# Altium schematic sheet Brojilo_zaslon.SchDoc
size A3; SheetNumber: 1; SheetTotal: 1; SPICEModelCacheWJDCJOHJ: <root> / <DocumentId>WJDCJOHJ</DocumentId> / </root>
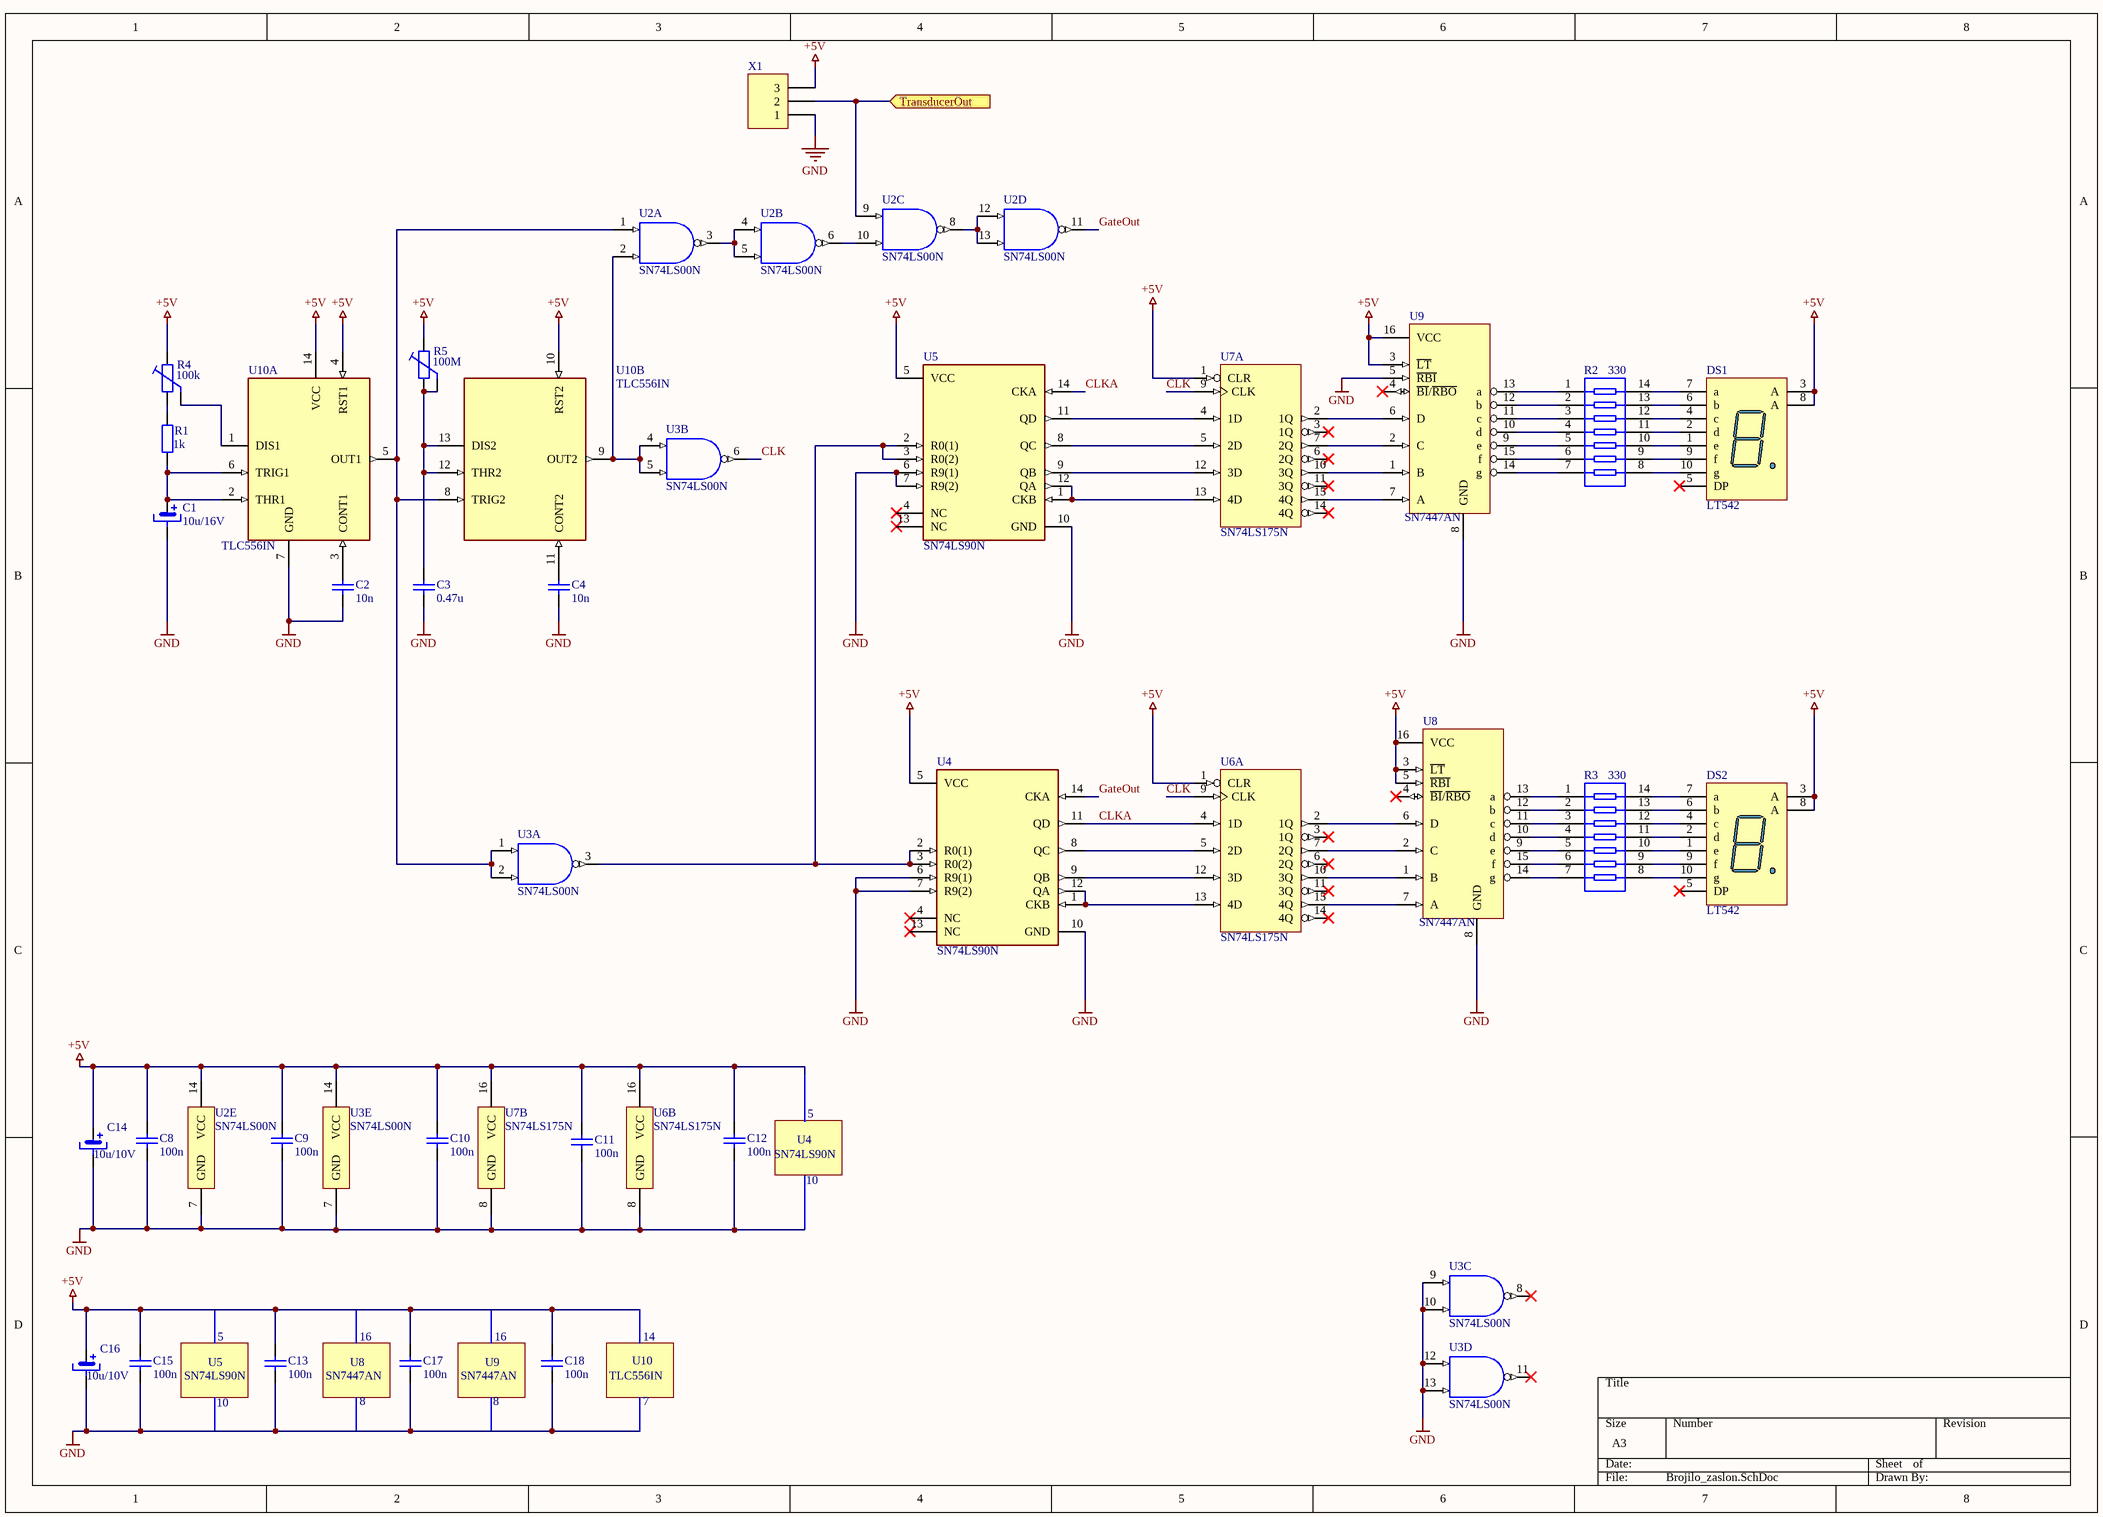
[diagram p0: Brojilo_zaslon.SchDoc]

## Parts
C1  10u/16V  [CAPR5-4x5]
C2  10n  [RAD-0.1]
C3  0.47u  [RAD-0.1]
C4  10n  [RAD-0.1]
C8  100n  [RAD-0.1]
C9  100n  [RAD-0.1]
C10  100n  [RAD-0.1]
C11  100n  [RAD-0.1]
C12  100n  [RAD-0.1]
C13  100n  [RAD-0.1]
C14  10u/10V  [CAPR5-4x5]
C15  100n  [RAD-0.1]
C16  10u/10V  [CAPR5-4x5]
C17  100n  [RAD-0.1]
C18  100n  [RAD-0.1]
DS1  LT542  [H]
DS2  LT542  [H]
R1  Vrijednost: 1k  [AXIAL-0.4]  (hidden comment: Res2)
R2  330  [DIP-14]
R3  330  [DIP-14]
R4  100k  [TRIMER]
R5  100M  [TRIMER]
U2  SN74LS00N  [N0014A]  (parts A,B,C,D,E of 5)
U3  SN74LS00N  [N0014A]  (parts A,B,C,D,E of 5)
U4  SN74LS90N  [FP-N0014A-MFG]
U5  SN74LS90N  [FP-N0014A-MFG]
U6  SN74LS175N  [N0016A]  (parts A,B of 2)
U7  SN74LS175N  [N0016A]  (parts A,B of 2)
U8  SN7447AN  [N0016A]
U9  SN7447AN  [N0016A]
U10  TLC556IN  [FP-N0014A-MFG]  (parts A,B of 2)
X1  (no value)  [HDR1X3]

## Ports
TransducerOut (in)

## Nets
+5V: C8.2 C9.2 C10.2 C11.2 C12.2 C13.2 C14.1 C15.2 C16.1 C17.2 C18.2 DS1.3(A) DS1.8(A) DS2.3(A) DS2.8(A) R4.1 R5.1 U2.14(VCC) U3.14(VCC) U4.5(VCC) U5.5(VCC) U6.1(CLR) U6.16(VCC) U7.1(CLR) U7.16(VCC) U8.3(~{LT}) U8.5(~{RBI}) U8.16(VCC) U9.3(~{LT}) U9.16(VCC) U10.4(RST1) U10.10(RST2) U10.14(VCC) X1.3
GND: C1.2 C2.1 C3.2 C4.1 C8.1 C9.1 C10.1 C11.1 C12.1 C13.1 C14.2 C15.1 C16.2 C17.1 C18.1 U2.7(GND) U3.7(GND) U3.9(3A) U3.10(3B) U3.12(4A) U3.13(4B) U4.6(R9(1)) U4.7(R9(2)) U4.10(GND) U5.6(R9(1)) U5.7(R9(2)) U5.10(GND) U6.8(GND) U7.8(GND) U8.8(GND) U9.5(~{RBI}) U9.8(GND) U10.7(GND) X1.1
CLK: U3.6(2Y) U6.9(CLK) U7.9(CLK)
CLKA: U4.11(QD) U5.14(CKA) U6.4(1D)
GateOut: U2.11(4Y) U4.14(CKA)
TransducerOut: U2.9(3A) X1.2 ; port TransducerOut
NetC1_1: C1.1 R1.1 U10.2(THR1) U10.6(TRIG1)
NetC2_2: C2.2 U10.3(CONT1)
NetC3_1: C3.1 R5.2 R5.3 U10.12(THR2) U10.13(DIS2)
NetC4_2: C4.2 U10.11(CONT2)
NetDS1_1: DS1.1(e) R2.10
NetDS1_2: DS1.2(d) R2.11
NetDS1_4: DS1.4(c) R2.12
NetDS1_6: DS1.6(b) R2.13
NetDS1_7: DS1.7(a) R2.14
NetDS1_9: DS1.9(f) R2.9
NetDS1_10: DS1.10(g) R2.8
NetDS2_1: DS2.1(e) R3.10
NetDS2_2: DS2.2(d) R3.11
NetDS2_4: DS2.4(c) R3.12
NetDS2_6: DS2.6(b) R3.13
NetDS2_7: DS2.7(a) R3.14
NetDS2_9: DS2.9(f) R3.9
NetDS2_10: DS2.10(g) R3.8
NetR1_2: R1.2 R4.3
NetR2_1: R2.1 U9.13(a)
NetR2_2: R2.2 U9.12(b)
NetR2_3: R2.3 U9.11(c)
NetR2_4: R2.4 U9.10(d)
NetR2_5: R2.5 U9.9(e)
NetR2_6: R2.6 U9.15(f)
NetR2_7: R2.7 U9.14(g)
NetR3_1: R3.1 U8.13(a)
NetR3_2: R3.2 U8.12(b)
NetR3_3: R3.3 U8.11(c)
NetR3_4: R3.4 U8.10(d)
NetR3_5: R3.5 U8.9(e)
NetR3_6: R3.6 U8.15(f)
NetR3_7: R3.7 U8.14(g)
NetR4_2: R4.2 U10.1(DIS1)
NetU2_1: U2.1(1A) U3.1(1A) U3.2(1B) U10.5(OUT1) U10.8(TRIG2)
NetU2_2: U2.2(1B) U3.4(2A) U3.5(2B) U10.9(OUT2)
NetU2_3: U2.3(1Y) U2.4(2A) U2.5(2B)
NetU2_6: U2.6(2Y) U2.10(3B)
NetU2_8: U2.8(3Y) U2.12(4A) U2.13(4B)
NetU3_3: U3.3(1Y) U4.2(R0(1)) U4.3(R0(2)) U5.2(R0(1)) U5.3(R0(2))
NetU4_1: U4.1(CKB) U4.12(QA) U6.13(4D)
NetU4_8: U4.8(QC) U6.5(2D)
NetU4_9: U4.9(QB) U6.12(3D)
NetU5_1: U5.1(CKB) U5.12(QA) U7.13(4D)
NetU5_8: U5.8(QC) U7.5(2D)
NetU5_9: U5.9(QB) U7.12(3D)
NetU5_11: U5.11(QD) U7.4(1D)
NetU6_2: U6.2(1Q) U8.6(D)
NetU6_7: U6.7(2Q) U8.2(C)
NetU6_10: U6.10(3Q) U8.1(B)
NetU6_15: U6.15(4Q) U8.7(A)
NetU7_2: U7.2(1Q) U9.6(D)
NetU7_7: U7.7(2Q) U9.2(C)
NetU7_10: U7.10(3Q) U9.1(B)
NetU7_15: U7.15(4Q) U9.7(A)

Not connected (* = marked no-connect by the designer): DS1 5(DP)*; DS2 5(DP)*; U3 8(3Y)* 11(4Y)*; U4 4(NC)* 13(NC)*; U5 4(NC)* 13(NC)*; U6 3(1Q)* 6(2Q)* 11(3Q)* 14(4Q)*; U7 3(1Q)* 6(2Q)* 11(3Q)* 14(4Q)*; U8 4(~{BI}/~{RBO})*; U9 4(~{BI}/~{RBO})*

## Notes on the sheet
- 5
- (near C12) SN74LS90N
- U4
- 10
- SN74LS90N
- U5
- SN7447AN
- U8
- (near C17) 16
- (near C17) 8
- U9
- 8
- (near C18) 16
- TLC556IN
- U10
- 14
- 7

## Library data of the parts
C1 = Elko: Cijena: €0,34; Dobavljac: DigiKey; Kataloški broj: P14391-ND; Proizvođač: Panasonic Electronic Components; Opis: Elektrolitski kondenzator 10u/16V; Kućište: 10x12.5mm; 2 izvoda; pitch 5.0mm; žičani izvodi; Vrijednost: 10u/16V
C2 C4 = Cap: Capacitor; Vrijednost: 0.01uF; Dobavljac: DigiKey; Cijena: €0,21; Kataloški broj: BC5134-ND; Proizvođač: Vishay Beyschlag/Draloric/BC Components; Opis: Keramički kondenzator 0.01uF; Kućište: 2.3x4.0mm; 2 izvoda; pitch 5.0mm; žičani izvodi; PackageReference: RAD-0.3
C3 = Cap: Capacitor; Vrijednost: 0.47uF; Dobavljac: DigiKey; Cijena: €0,18; Kataloški broj: 445-173587-3-ND; Proizvođač: TDK; Opis: Keramički kondenzator 0.47uF; Kućište: 0805; PackageReference: RAD-0.3
C8-C13 C15 C17 C18 = Cap: Capacitor; Vrijednost: 100nF; Dobavljac: DigiKey; Cijena: €0,23; Kataloški broj: BC3324-ND; Proizvođač: Vishay Beyschlag/Draloric/BC Components; Opis: Keramički kondenzator 100nF; Kućište: 2.3x6.0mm; 2 izvoda; pitch 7.5mm; žičani izvodi; PackageReference: RAD-0.3
C14 C16 = Elko: Dobavljac: DigiKey; Cijena: €0,18; Kataloški broj: 399-ESK106M010AC3AA-ND; Proizvođač: KEMET; Opis: Elektrolitski kondenzator 10u/10V; Kućište: 5x11mm; 2 izvoda; pitch 2.0mm; žičani izvodi; Vrijednost: 10u/10V
DS1 DS2 = Dpy Blue-CA: 14.2 mm General Purpose Blue 7-Segment Display: CA, RH DP, Gray Surface; Dobavljac: DigiKey; Cijena: €1,90; Kataloški broj: 754-2281-ND; Proizvođač: Kingbright; Opis: 7-segmentni zaslon; Kućište: 0603
R1 = Res2: Resistor; Dobavljac: DigiKey; Cijena: €0,09; Kataloški broj: 1.00KXBK-ND; Proizvođač: YAGEO; Opis: Otpornik 1kOhm; Kućište: 2.5x6.8mm; 2 izvoda; pitch 10mm; žičani izvodi; PackageReference: AXIAL-0.4
R2 R3 = Res Pack4: Isolated Resistor Network; Dobavljac: DigiKey; Kataloški broj: 4114R-1-331LF-ND; Cijena: €3,37; Proizvođač: Bourns Inc.; Opis: Mreža 7 otpornika 330 Ohm; Kućište: DIP-14
R4 = Trimer: Cijena: €3,09; Dobavljac: DigiKey; Kataloški broj: 3296W-104-ND; Kućište: 9.53x4.83x10.03mm; 3 izvoda; pitch 2.54mm; žičani izvodi; Opis: Trimer 100kOhm; Proizvođač: Bourns Inc.
R5 = Trimer: Dobavljac: DigiKey
U2 U3 = CMP-1627-00476-2: Quad 2-input positive-NAND gates, N0014A, TUBE; Kataloški broj: 296-1626-ND; Dobavljac: DigiKey; Cijena: €0,66; Proizvođač: Texas Instruments; Opis: Četverostruka NI (NAND) vrata; Kućište: SOIC-14
U4 U5 = SN74LS90: IC DECADE COUNTER 14-DIP; Dobavljac: DigiKey; Kataloški broj: 296-34031-5-ND; Cijena: €3,03; Proizvođač: Texas Instruments; Opis: Dekadsko brojilo; Kućište: SOIC-14
U6 U7 = CMP-1616-00100-3: Quadruple D-Type Flip-Flops With Clear, N0016A, TUBE; Dobavljac: DigiKey; Kataloški broj: 296-1648-5-ND; Cijena: €1,03; Proizvođač: Texas Instruments; Opis: 4-bitni D flip-flop registar s resetom; Kućište: SOIC-16
U8 U9 = SN7447AN: BCD-to-7-Segment Decoder / Driver, 4.75 to 5.25 V, 0 to 70 degC, 16-pin DIP (N16), Pb-Free (RoHS); Dobavljac: DigiKey; Kataloški broj: 296-33612-5-ND; Cijena: €3,83; Proizvođač: Texas Instruments; Opis: BCD u 7-segmentni dekoder; Kućište: SOIC-16
U10 = TLC556IN: IC OSC TIMER DUAL 2.1MHZ 14-DIP; Cijena: €1,51; Dobavljac: DigiKey; Kataloški broj: 296-10344-5-ND; Kućište: SOIC-16; Opis: Sklop za upravljanje vremenom; Proizvođač: Texas Instruments
X1 = Header 3: Header, 3-Pin; Dobavljac: DigiKey; Cijena: €0,28; Kataloški broj: S1011EC-03-ND; Proizvođač: Sullins Connector Solutions; Opis: 3-pinski konektor; Kućište: 7.62x2.54mm; 3 izvoda; pitch 2.54mm; žičani izvodi